# Altium project CAN_Gauge.PrjPcb
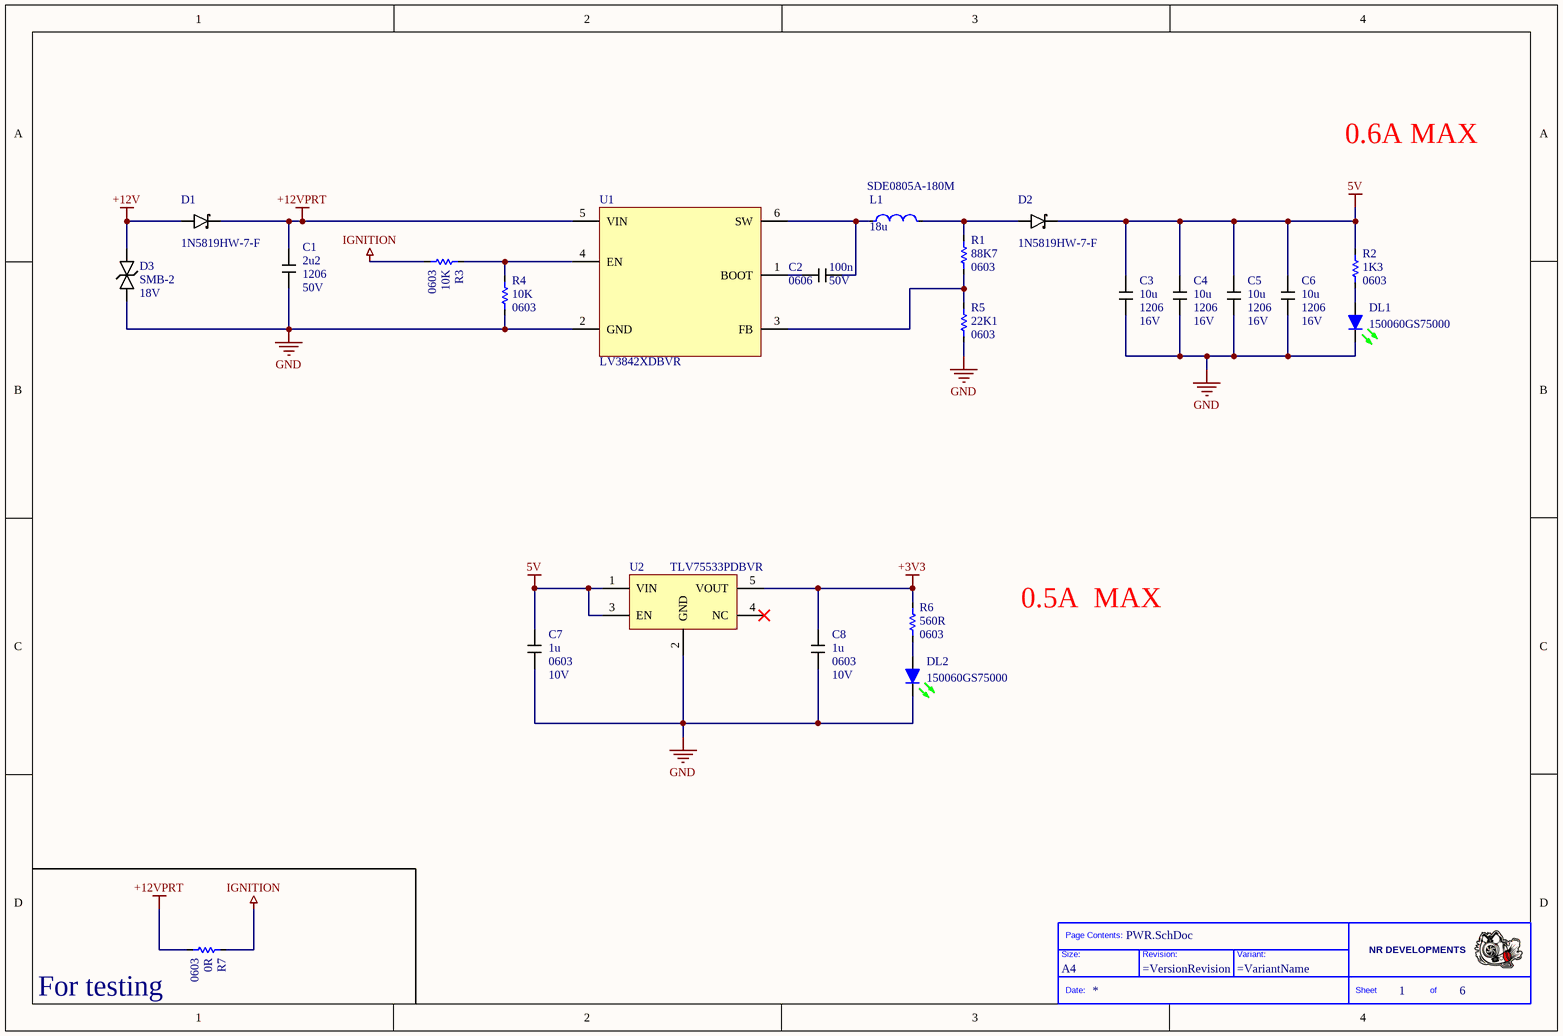
[diagram p0: PWR.SchDoc]
6 sheets, 74 parts. Net scope: flat (ports and power ports of the same name join across sheets).
Board file: Can_Gauge_PCB.PcbDoc
Sheets:
  PWR.SchDoc
  CAN.SchDoc
  Sensor.SchDoc
  Mcu.SchDoc
  Connector.SchDoc
  Display.SchDoc

## Sheet PWR.SchDoc
size A4; SheetNumber: 1; SheetTotal: 6

### Parts
(Parts that share a designator on the sheet are numbered #1, #2 ... from top to bottom, then left to right.)
*#1  Size: A4  (hidden comment: Title_Block)  (graphical)
C1  value 2u2  Case: 1206  Voltage: 50V  [CAPC3216X16M]  (hidden comment: CAP)
C2  value 100n  Case: 0606  Voltage: 50V  [CAPC1608X09M]  (hidden comment: CAP)
C3  value 10u  Case: 1206  Voltage: 16V  [CAPC3216X16M]  (hidden comment: CAP)
C4  value 10u  Case: 1206  Voltage: 16V  [CAPC3216X16M]  (hidden comment: CAP)
C5  value 10u  Case: 1206  Voltage: 16V  [CAPC3216X16M]  (hidden comment: CAP)
C6  value 10u  Case: 1206  Voltage: 16V  [CAPC3216X16M]  (hidden comment: CAP)
C7  value 1u  Case: 0603  Voltage: 10V  [CAPC1608X09M]  (hidden comment: CAP)
C8  value 1u  Case: 0603  Voltage: 10V  [CAPC1608X09M]  (hidden comment: CAP)
D1  value 1N5819HW-7-F  [SODFL360X130-2M -AC]  (hidden comment: Diode_Schottky)
D2  value 1N5819HW-7-F  [SODFL360X130-2M -AC]  (hidden comment: Diode_Schottky)
D3  Case: SMB-2  Voltage: 18V  [ONSC-SMB-2]  (hidden comment: Diode)
DL1  value 150060GS75000  [LED0603]  (hidden comment: LED_Green)
DL2  value 150060GS75000  [LED0603]  (hidden comment: LED_Green)
L1  value 18u  PartNumber: SDE0805A-180M  [BOURNS_SDE0805A]  (hidden comment: IND)
R1  value 88K7  Case: 0603  [RESC1608X06M]  (hidden comment: Res)
R2  value 1K3  Case: 0603  [RESC1608X06M]  (hidden comment: Res)
R3  value 10K  Case: 0603  [RESC1608X06M]  (hidden comment: Res)
R4  value 10K  Case: 0603  [RESC1608X06M]  (hidden comment: Res)
R5  value 22K1  Case: 0603  [RESC1608X06M]  (hidden comment: Res)
R6  value 560R  Case: 0603  [RESC1608X06M]  (hidden comment: Res)
R7  value 0R  Case: 0603  [RESC1608X06M]  (hidden comment: Res)
U1  value LV3842XDBVR  [SOT95P280X145-6N]  (hidden comment: DC DC)
U2  value TLV75533PDBVR  [SOT95P280X145-5N]  (hidden comment: TLV75530PDBVR)

### Nets
5V: C3.1 C4.1 C5.1 C6.1 C7.1 D2.C R2.2 U2.1(VIN) U2.3(EN)
+3V3: C8.1 R6.2 U2.5(VOUT)
+12V: D1.A D3.2
+12VPRT: C1.1 D1.C R7.1 U1.5(VIN)
GND: C1.2 C3.2 C4.2 C5.2 C6.2 C7.2 C8.2 D3.1 DL1.C DL2.C R4.1 R5.1 U1.2(GND) U2.2(GND)
IGNITION: R3.1 R7.2
NetC2_1: C2.1 U1.1(BOOT)
NetC2_2: C2.2 L1.1 U1.6(SW)
NetD2_A: D2.A L1.2 R1.2
NetDL1_A: DL1.A R2.1
NetDL2_A: DL2.A R6.1
NetR1_1: R1.1 R5.2 U1.3(FB)
NetR3_2: R3.2 R4.2 U1.4(EN)

Not connected (* = marked no-connect by the designer): U2 4(NC)*

### Notes on the sheet
- 0.6A MAX
- 0.5A  MAX
- (near R7) For testing
- (in symbol Title_Block) Page Contents:; NR DEVELOPMENTS; Size:; Revision:; Variant:; Date:; Sheet; of

### Library data of the parts
C1 = CAP: Manufacturer: KEMET; PartNumber: C1206C225K5RAC
C2 = CAP: Manufacturer: KEMET; PartNumber: C0603C104K5RACTU
C3-C6 = CAP: Manufacturer: KEMET; PartNumber: C1206C106K4RAC7800
C7 C8 = CAP: Manufacturer: KEMET; PartNumber: C0603C105K8RACTU
D1 D2 = Diode_Schottky: Manufacturer: Diodes Incorporated; PartNumber: 1N5819HW-7-F; Case: SOD123
D3 = Diode_TVS_Bid: Manufacturer: Microchip Technology; Value: SMBJ18CAe3/TR13; PartNumber: SMBJ18CAe3/TR13
DL1 DL2 = LED_Green: Manufacturer: Wurth Elektronik; Case: 0603; PartNumber: 150060GS75000
L1 = IND: Manufacturer: BOURNS; Case: SDE0805A
R1 = Resistor: Manufacturer: Vishay; PartNumber: CRCW060388K7FKEAC
R2 = Resistor: Manufacturer: Vishay; PartNumber: CRCW06031K30FKEAC
R3 R4 = Resistor: Manufacturer: Vishay; PartNumber: CRCW060310K0JNEAC
R5 = Resistor: Manufacturer: Vishay; PartNumber: CRCW060322K1FKEA
R6 = Resistor: Manufacturer: Vishay; PartNumber: CRCW0603560RJNEAC
R7 = Resistor: Manufacturer: Vishay; PartNumber: CRCW06030000Z0EE
U1 = LV3842XDBVR: 4-V to 36-V, 600-mA synchronous step-down converter; Manufacturer: Texas Instruments; PartNumber: LV3842XDBVR; Case: 6-SOT-23
U2 = TLV75530PDBVR: LDO Voltage Regulators 500-mA high-PSRR low-IQ low-dropout voltage regulator with enable; Manufacturer: Texas Instruments; PartNumber: TLV75533PDBVR; Case: SOT-23-5

## Sheet CAN.SchDoc
size A4; SheetNumber: 2; SheetTotal: 6
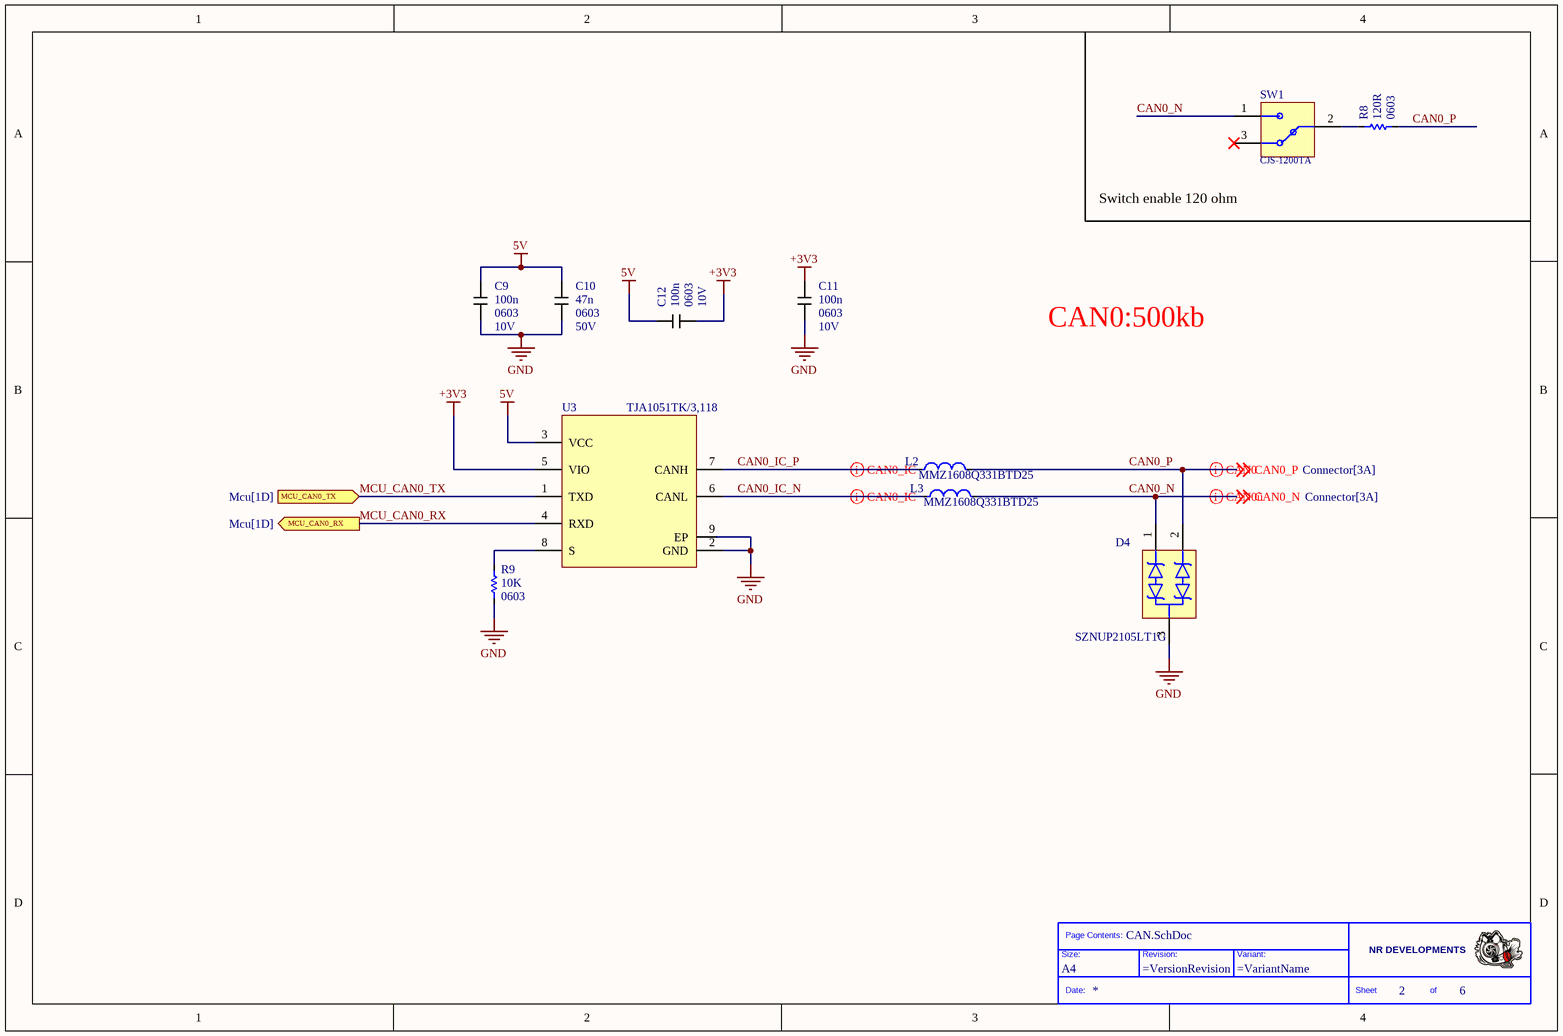
[diagram p1: CAN.SchDoc]

### Parts
(Parts that share a designator on the sheet are numbered #1, #2 ... from top to bottom, then left to right.)
*#2  Size: A4  (hidden comment: Title_Block)  (graphical)
C9  value 100n  Case: 0603  Voltage: 10V  [CAPC1608X09M]  (hidden comment: C0603C104K5RACTU)
C10  value 47n  Case: 0603  Voltage: 50V  [CAPC1608X09M]  (hidden comment: C0603X473K5RAC3316)
C11  value 100n  Case: 0603  Voltage: 10V  [CAPC1608X09M]  (hidden comment: C0603C104K5RACTU)
C12  value 100n  Case: 0603  Voltage: 10V  [CAPC1608X09M]  (hidden comment: C0603C104K5RACTU)
D4  value SZNUP2105LT1G  [SOT95P240X120-3N]  (hidden comment: SM712-02HTG)
L2  value MMZ1608Q331BTD25  [INDC1608X09N]  (hidden comment: BLM18HB331SN1D)
L3  value MMZ1608Q331BTD25  [INDC1608X09N]  (hidden comment: BLM18HB331SN1D)
R8  value 120R  Case: 0603  [RESC1608X06M]  (hidden comment: CRCW0603120RFKEA)
R9  value 10K  Case: 0603  [RESC1608X06M]  (hidden comment: CRCW060310K0FKEA)
SW1  value CJS-1200TA  [SW_CJS-1200TA]  (hidden comment: Switch SPDT)
U3  TJA1051TK/3,118  [SON65P300X300X100-9N-D]

### Ports
MCU_CAN0_RX (out, see Mcu[1D]), MCU_CAN0_TX (in, see Mcu[1D])

### Nets
5V: C9.1 C10.1 C12.1 U3.3(VCC)
+3V3: C11.1 C12.2 U3.5(VIO)
GND: C9.2 C10.2 C11.2 D4.3 R9.1 U3.2(GND) U3.9(EP)
CAN0_IC_N: L3.1 U3.6(CANL)
CAN0_IC_P: L2.1 U3.7(CANH)
CAN0_N: D4.1 L3.2 SW1.1 ; off-sheet CAN0_N
CAN0_P: D4.2 L2.2 R8.1 ; off-sheet CAN0_P
MCU_CAN0_RX: U3.4(RXD) ; port MCU_CAN0_RX
MCU_CAN0_TX: U3.1(TXD) ; port MCU_CAN0_TX
NetR8_2: R8.2 SW1.2
NetR9_2: R9.2 U3.8(S)

Not connected (* = marked no-connect by the designer): SW1 3*

### Layout directives
differential pair: CAN0_IC_N, CAN0_IC_P, CAN0_N, CAN0_P

### Notes on the sheet
- (near SW1) Switch enable 120 ohm
- CAN0:500kb
- (in symbol Title_Block) Page Contents:; NR DEVELOPMENTS; Size:; Revision:; Variant:; Date:; Sheet; of

### Library data of the parts
C9-C12 = CAP: Manufacturer: KEMET; SMD/PTH: SMD
  C9 C11 C12: PartNumber: C0603C104K5RACTU
  C10: PartNumber: C0603X473K5RAC3316
D4 = SM712-02HTG: ESD Diode bid; Manufacturer: Onsemi; SMD/PTH: SMD; Case: SOT23-3; PartNumber: SZNUP2105LT1G
L2 L3 = IND: Manufacturer: TDK; SMD/PTH: SMD; Case: 0603; PartNumber: MMZ1608Q331BTD25
R8 R9 = Resistor: Manufacturer: Vishay; SMD/PTH: SMD
  R8: PartNumber: CRCW0603120RFKEA
  R9: PartNumber: CRCW060310K0FKEA
SW1 = SWITCH_SPDT: Manufacturer: Nidec Components; PartNumber: CJS-1200TA
U3 = TJA1051TK/3: CAN HIGH-SPEED CAN TRANSCEIVER 3.3V / 5V Pin VIO; Manufacturer: NXP Semiconductors; SMD/PTH: SMD; Value: TJA1051TK/3,118; Case: HVSON-8; PartNumber: TJA1051TK/3,118

## Sheet Sensor.SchDoc
size A4; SheetNumber: 3; SheetTotal: 6
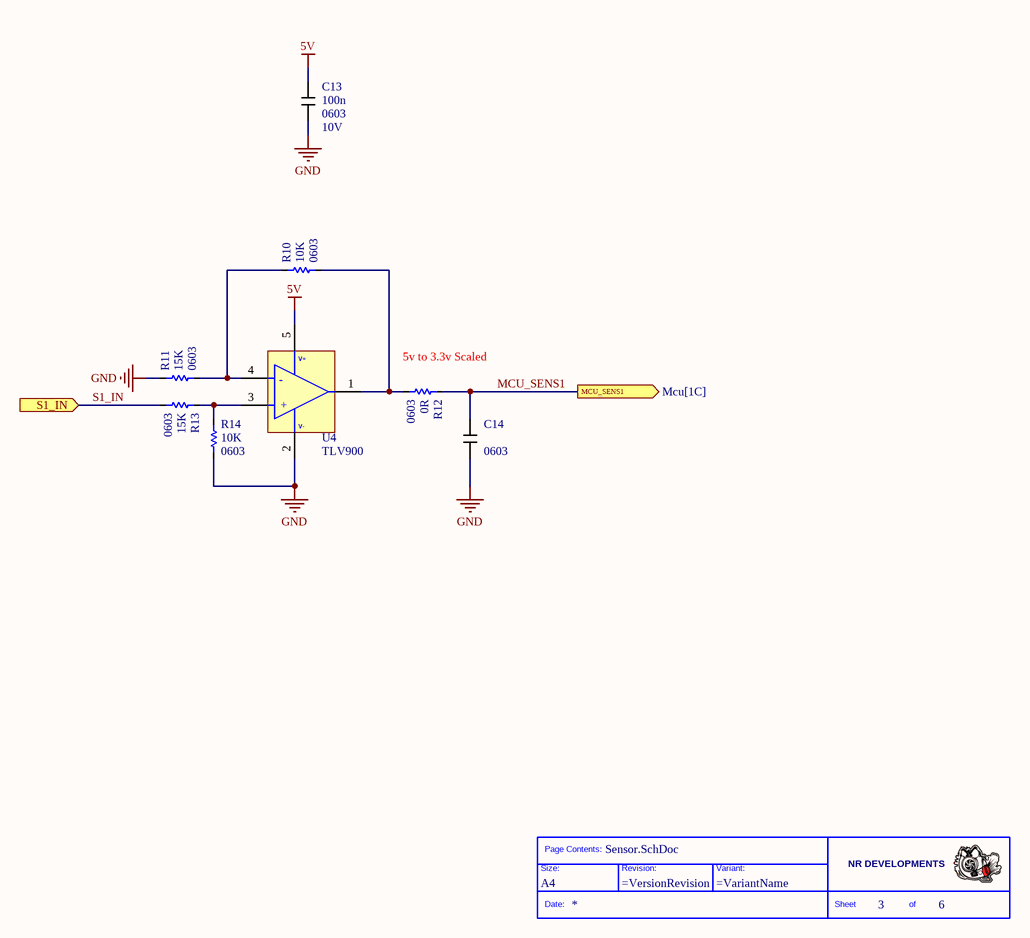
[diagram p2: Sensor.SchDoc]

### Parts
(Parts that share a designator on the sheet are numbered #1, #2 ... from top to bottom, then left to right.)
*#3  Size: A4  (hidden comment: Title_Block)  (graphical)
C13  value 100n  Case: 0603  Voltage: 10V  [CAPC1608X09M]  (hidden comment: C0603C104K5RACTU)
C14  Case: 0603  [CAPC1608X09M]
R10  value 10K  Case: 0603  [RESC1608X06M]  (hidden comment: CRCW060310K0FKEA)
R11  value 15K  Case: 0603  [RESC1608X06M]  (hidden comment: CRCW060315K0FKEC)
R12  value 0R  Case: 0603  [RESC1608X06M]  (hidden comment: CRCW06030000Z0EAC)
R13  value 15K  Case: 0603  [RESC1608X06M]  (hidden comment: CRCW060315K0FKEC)
R14  value 10K  Case: 0603  [RESC1608X06M]  (hidden comment: CRCW060310K0FKEA)
U4  TLV900  [SOT95P280X145-5N]

### Ports
MCU_SENS1 (out, see Mcu[1C]), S1_IN (in)

### Nets
5V: C13.1 U4.5(V+)
GND: C13.2 C14.2 R11.2 R14.1 U4.2(V-)
MCU_SENS1: C14.1 R12.2 ; port MCU_SENS1
S1_IN: R13.1 ; port S1_IN
NetR10_1: R10.1 R12.1 U4.1(OUTA)
NetR10_2: R10.2 R11.1 U4.4(IN-)
NetR13_2: R13.2 R14.2 U4.3(IN+)

### Notes on the sheet
- (near R12) 5v to 3.3v Scaled
- (in symbol Title_Block) Page Contents:; NR DEVELOPMENTS; Size:; Revision:; Variant:; Date:; Sheet; of
- (in symbol TLV900) -; +

### Library data of the parts
C13 = CAP: Manufacturer: KEMET; SMD/PTH: SMD; PartNumber: C0603C104K5RACTU
C14 = CAP
R10 R11 R13 R14 = Resistor: Manufacturer: Vishay
  R10 R14: PartNumber: CRCW060310K0FKEA
  R11 R13: PartNumber: CRCW060315K0FKEC
R12 = Resistor: as R7 on sheet PWR
U4 = TLV900: Amp. op. One-channel, 1-MHz rail-to-rail input and output 1.8-V to 5.5-V operational amplifier 5-SOT-23 -40 to 125; Manufacturer: Texas Instrument; PartNumber: TLV9001IDBVR; SMD/PTH: SMD; Value: TLV9001IDBVR; Case: SOT23-5

## Sheet Mcu.SchDoc
size A4; SheetNumber: 4; SheetTotal: 6
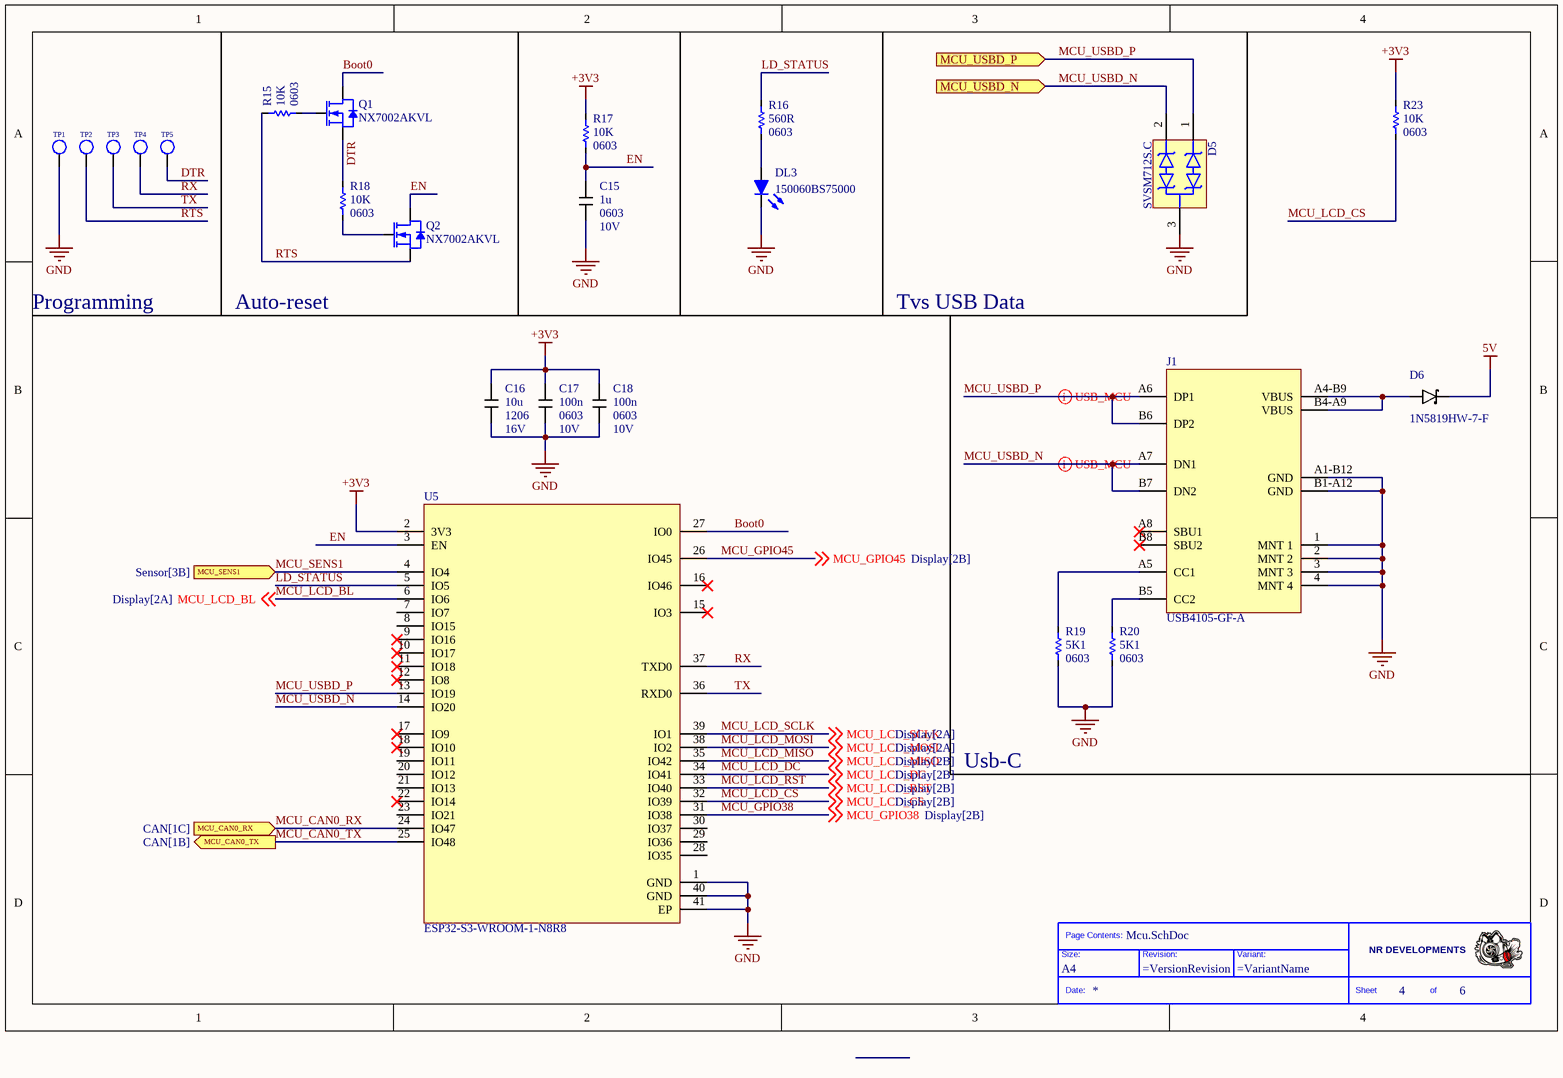
[diagram p3: Mcu.SchDoc]

### Parts
*?  Size: A4  (hidden comment: Title_Block)  (graphical)
C15  value 1u  Case: 0603  Voltage: 10V  [CAPC1608X09M]  (hidden comment: C0603C105K8RACTU)
C16  value 10u  Case: 1206  Voltage: 16V  [CAPC3216X16M]  (hidden comment: GCJ31CR71A106MA13L)
C17  value 100n  Case: 0603  Voltage: 10V  [CAPC1608X09M]  (hidden comment: C0603C104K5RACTU)
C18  value 100n  Case: 0603  Voltage: 10V  [CAPC1608X09M]  (hidden comment: C0603C104K5RACTU)
D5  value SVSM712S.C  [SOT95P240X120-3N]  (hidden comment: SM712-02HTG)
D6  value 1N5819HW-7-F  [SODFL360X130-2M -AC]  (hidden comment: Diode_Schottky)
DL3  150060BS75000  [LED0603]
J1  USB4105-GF-A  [GCT-USB4105-GF-A]
Q1  value NX7002AKVL  [SOT95P240X120-3N - GDS]  (hidden comment: BVSS138LT1G)
Q2  value NX7002AKVL  [SOT95P240X120-3N - GDS]  (hidden comment: BVSS138LT1G)
R15  value 10K  Case: 0603  [RESC1608X06M]  (hidden comment: CRCW060310K0FKEA)
R16  value 560R  Case: 0603  [RESC1608X06M]  (hidden comment: RC0603FR-07560RL)
R17  value 10K  Case: 0603  [RESC1608X06M]  (hidden comment: CRCW060310K0FKEA)
R18  value 10K  Case: 0603  [RESC1608X06M]  (hidden comment: CRCW060310K0FKEA)
R19  value 5K1  Case: 0603  [RESC1608X06M]  (hidden comment: Resistor)
R20  value 5K1  Case: 0603  [RESC1608X06M]  (hidden comment: Resistor)
R23  value 10K  Case: 0603  [RESC1608X06M]  (hidden comment: CRCW060310K0FKEA)
TP1  Test_Point  [TP_c200]  (value not drawn)
TP2  Test_Point  [TP_c200]  (value not drawn)
TP3  Test_Point  [TP_c200]  (value not drawn)
TP4  Test_Point  [TP_c200]  (value not drawn)
TP5  Test_Point  [TP_c200]  (value not drawn)
U5  value ESP32-S3-WROOM-1-N8R8  [ESPRESSIF_ESP32-S3-WROOM-1-N]  (hidden comment: ESP32-S3-WROOM-1-N)

### Ports
MCU_CAN0_RX (in, see CAN[1C]), MCU_CAN0_TX (out, see CAN[1B]), MCU_SENS1 (in, see Sensor[3B]), MCU_USBD_N (in), MCU_USBD_P (in)

### Nets
5V: D6.C
+3V3: C16.1 C17.1 C18.1 R17.2 R23.2 U5.2(3V3)
GND: C15.2 C16.2 C17.2 C18.2 D5.3 DL3.C J1.1(MNT_1) J1.2(MNT_2) J1.3(MNT_3) J1.4(MNT_4) J1.A1-B12(GND) J1.B1-A12(GND) R19.1 R20.1 TP1.1 U5.1(GND) U5.40(GND) U5.41(EP)
Boot0: Q1.D U5.27(IO0)
DTR: Q1.S R18.2 TP5.1
EN: C15.1 Q2.D R17.1 U5.3(EN)
LD_STATUS: R16.2 U5.5(IO5)
MCU_CAN0_RX: U5.24(IO47) ; port MCU_CAN0_RX
MCU_CAN0_TX: U5.25(IO48) ; port MCU_CAN0_TX
MCU_GPIO38: U5.31(IO38) ; off-sheet MCU_GPIO38
MCU_GPIO45: U5.26(IO45) ; off-sheet MCU_GPIO45
MCU_LCD_BL: U5.6(IO6) ; off-sheet MCU_LCD_BL
MCU_LCD_CS: R23.1 U5.32(IO39) ; off-sheet MCU_LCD_CS
MCU_LCD_DC: U5.34(IO41) ; off-sheet MCU_LCD_DC
MCU_LCD_MISO: U5.35(IO42) ; off-sheet MCU_LCD_MISO
MCU_LCD_MOSI: U5.38(IO2) ; off-sheet MCU_LCD_MOSI
MCU_LCD_RST: U5.33(IO40) ; off-sheet MCU_LCD_RST
MCU_LCD_SCLK: U5.39(IO1) ; off-sheet MCU_LCD_SCLK
MCU_SENS1: U5.4(IO4) ; port MCU_SENS1
MCU_USBD_N: D5.2 J1.A7(DN1) J1.B7(DN2) U5.14(IO20) ; port MCU_USBD_N
MCU_USBD_P: D5.1 J1.A6(DP1) J1.B6(DP2) U5.13(IO19) ; port MCU_USBD_P
RTS: Q2.S R15.2 TP2.1
RX: TP4.1 U5.37(TXD0)
TX: TP3.1 U5.36(RXD0)
NetD6_A: D6.A J1.A4-B9(VBUS) J1.B4-A9(VBUS)
NetDL3_A: DL3.A R16.1
NetJ1_A5: J1.A5(CC1) R19.2
NetJ1_B5: J1.B5(CC2) R20.2
NetQ1_G: Q1.G R15.1
NetQ2_G: Q2.G R18.1

Not connected (* = marked no-connect by the designer): J1 A8(SBU1)* B8(SBU2)*; U5 7(IO7) 8(IO15_) 9(IO16)* 10(IO17)* 11(IO18)* 12(IO8)* 15(IO3)* 16(IO46)* 17(IO9)* 18(IO10)* 19(IO11) 20(IO12) 21(IO13) 22(IO14)* 23(IO21) 28(IO35) 29(IO36) 30(IO37)

### Layout directives
differential pair: MCU_USBD_N, MCU_USBD_P

### Notes on the sheet
- Programming
- Auto-reset
- Tvs USB Data
- Usb-C
- (in symbol Title_Block) Page Contents:; NR DEVELOPMENTS; Size:; Revision:; Variant:; Date:; Sheet; of

### Library data of the parts
C15 C17 C18 = CAP: Manufacturer: KEMET; SMD/PTH: SMD
  C15: PartNumber: C0603C105K8RACTU
  C17 C18: PartNumber: C0603C104K5RACTU
C16 = CAP: Manufacturer: KEMET; PartNumber: C1206C106K4RAC7800; SMD/PTH: SMD
D5 = SM712-02HTG: ESD Diode bid -7 to 12v; Manufacturer: Semtech; PartNumber: SVSM712S.C; Case: SOT23-3
D6 = Diode_Schottky: Manufacturer: Diodes Incorporated; PartNumber: 1N5819HW-7-F; Case: SOD123
DL3 = LED_Blue: Manufacturer: Wurth Elektronik; SMD/PTH: SMD; Value: 150060BS75000; Case: 0603; PartNumber: 150060BS75000
J1 = USB4105-GF-A: USB Connectors USB Type C,2.0, Rec,SMT, 0.95mmTH Shell Stakes,G/F,RA,Top Mnt,T&R; Manufacturer: GCT; PartNumber: USB4105-GF-A; Value: USB4105-GF-A; Case: USB-C
Q1 Q2 = TRAN_NMOS_3P: Manufacturer: Nexperia; SMD/PTH: SMD; Case: SOT23-3; PartNumber: NX7002AKVL
R15 R17 R18 R23 = Resistor: Manufacturer: Vishay; SMD/PTH: SMD; PartNumber: CRCW060310K0FKEA
R16 = Resistor: Manufacturer: Vishay; PartNumber: CRCW0603560RJNEAC; SMD/PTH: SMD
R19 R20 = Resistor: Manufacturer: Vishay; PartNumber: CRCW06035K10FKEC
TP1-TP5 = Test_Point: Test Poin
U5 = ESP32-S3-WROOM-1-N: ESP32 S3 WROOM 1; Manufacturer: Espressif Systems; SMD/PTH: SMD; PartNumber: ESP32-S3-WROOM-1-N8R8

## Sheet Connector.SchDoc
size A4; SheetNumber: 5; SheetTotal: 5
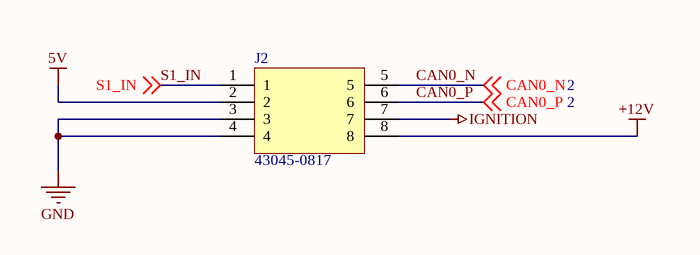
[diagram p4: Connector.SchDoc]

### Parts
J2  value 43045-0817  [MOLEX_430450817]  (hidden comment: MOLEX_43045-0817)

### Nets
5V: J2.2
+12V: J2.8
GND: J2.3 J2.4
IGNITION: J2.7
CAN0_N: J2.5 ; off-sheet CAN0_N
CAN0_P: J2.6 ; off-sheet CAN0_P
S1_IN: J2.1 ; off-sheet S1_IN

### Library data of the parts
J2 = MOLEX_43045-0817: Micro-Fit 3.0 Vertical Header, 3.00mm Pitch, Dual Row, 8 Circuits, with PCB Press-fit Metal Retention Clip, Glow-Wire Capable; Manufacturer: Molex; PartNumber: 43045-0817

## Sheet Display.SchDoc
size A4; SheetNumber: 6; SheetTotal: 6
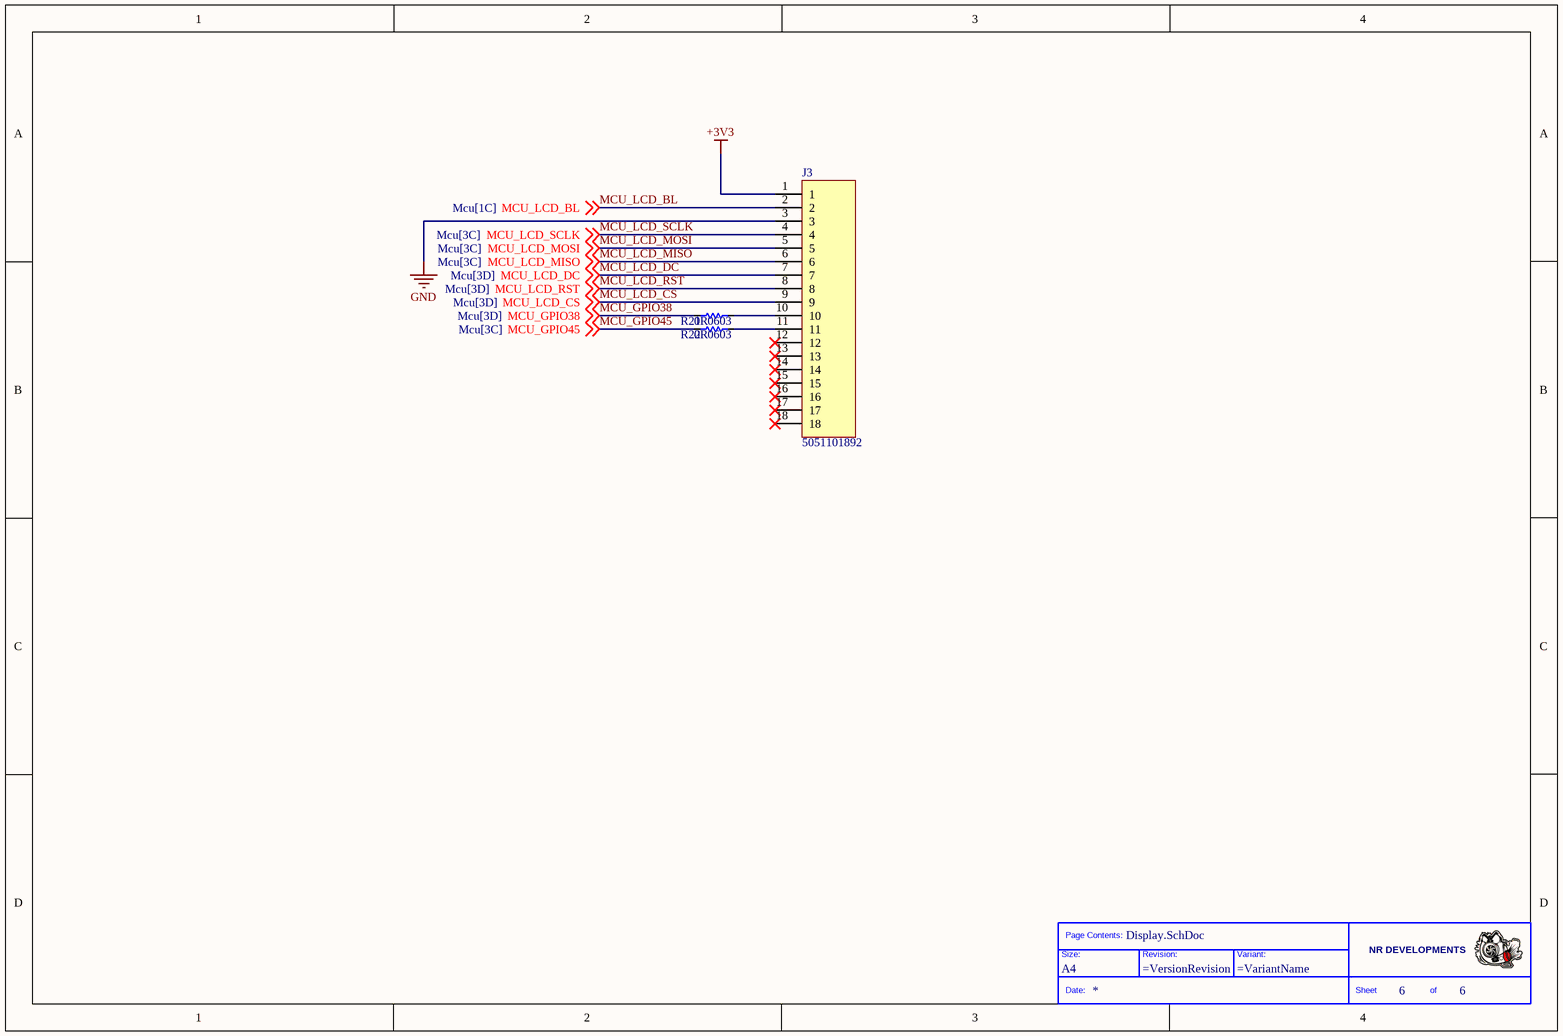
[diagram p5: Display.SchDoc]

### Parts
(Parts that share a designator on the sheet are numbered #1, #2 ... from top to bottom, then left to right.)
*#4  Size: A4  (hidden comment: Title_Block)  (graphical)
J3  value 5051101892  [MOLEX_5051101892]  (hidden comment: MOLEX_5051101892)
R21  value 0R  Case: 0603  [RESC1608X06M]  (hidden comment: CRCW06030000Z0EAC)
R22  value 0R  Case: 0603  [RESC1608X06M]  (hidden comment: CRCW06030000Z0EAC)

### Nets
+3V3: J3.1
GND: J3.3
MCU_GPIO38: R21.1 ; off-sheet MCU_GPIO38
MCU_GPIO45: R22.1 ; off-sheet MCU_GPIO45
MCU_LCD_BL: J3.2 ; off-sheet MCU_LCD_BL
MCU_LCD_CS: J3.9 ; off-sheet MCU_LCD_CS
MCU_LCD_DC: J3.7 ; off-sheet MCU_LCD_DC
MCU_LCD_MISO: J3.6 ; off-sheet MCU_LCD_MISO
MCU_LCD_MOSI: J3.5 ; off-sheet MCU_LCD_MOSI
MCU_LCD_RST: J3.8 ; off-sheet MCU_LCD_RST
MCU_LCD_SCLK: J3.4 ; off-sheet MCU_LCD_SCLK
NetJ3_10: J3.10 R21.2
NetJ3_11: J3.11 R22.2

Not connected (* = marked no-connect by the designer): J3 12* 13* 14* 15* 16* 17* 18*

### Notes on the sheet
- (in symbol Title_Block) Page Contents:; NR DEVELOPMENTS; Size:; Revision:; Variant:; Date:; Sheet; of

### Library data of the parts
J3 = MOLEX_5051101892: 18 Position FFC, FPC Connector Contacts, Bottom 0.020" (0.50mm) Surface Mount, Right Angle; Manufacturer: Molex; PartNumber: 5051101892
R21 R22 = Resistor: as R7 on sheet PWR

## Nets that join several sheets
5V: PWR (9 pins), CAN (C9.1 C10.1 C12.1 U3.3), Sensor (C13.1 U4.5), Mcu (D6.C), Connector (J2.2)
+3V3: PWR (C8.1 R6.2 U2.5), CAN (C11.1 C12.2 U3.5), Mcu (6 pins), Display (J3.1)
+12V: PWR (D1.A D3.2), Connector (J2.8)
GND: PWR (14 pins), CAN (7 pins), Sensor (5 pins), Mcu (18 pins), Connector (J2.3 J2.4), Display (J3.3)
IGNITION: PWR (R3.1 R7.2), Connector (J2.7)
CAN0_N: CAN (D4.1 L3.2 SW1.1), Connector (J2.5)
CAN0_P: CAN (D4.2 L2.2 R8.1), Connector (J2.6)
MCU_CAN0_RX: CAN (U3.4), Mcu (U5.24)
MCU_CAN0_TX: CAN (U3.1), Mcu (U5.25)
MCU_GPIO38: Mcu (U5.31), Display (R21.1)
MCU_GPIO45: Mcu (U5.26), Display (R22.1)
MCU_LCD_BL: Mcu (U5.6), Display (J3.2)
MCU_LCD_CS: Mcu (R23.1 U5.32), Display (J3.9)
MCU_LCD_DC: Mcu (U5.34), Display (J3.7)
MCU_LCD_MISO: Mcu (U5.35), Display (J3.6)
MCU_LCD_MOSI: Mcu (U5.38), Display (J3.5)
MCU_LCD_RST: Mcu (U5.33), Display (J3.8)
MCU_LCD_SCLK: Mcu (U5.39), Display (J3.4)
MCU_SENS1: Sensor (C14.1 R12.2), Mcu (U5.4)

## Assembly variants
V1: all parts fitted